# EasyEDA Pro project DDS.eprj

# Schematic Schematic1
Board Name: Board1; Create Date: 2026-07-16; Page Name: P1; Project Name: DDS; Schematic Name: Schematic1; Update Date: 2026-07-16; Company: 嘉立创EDA; Page Size: A4; Version: V1.0
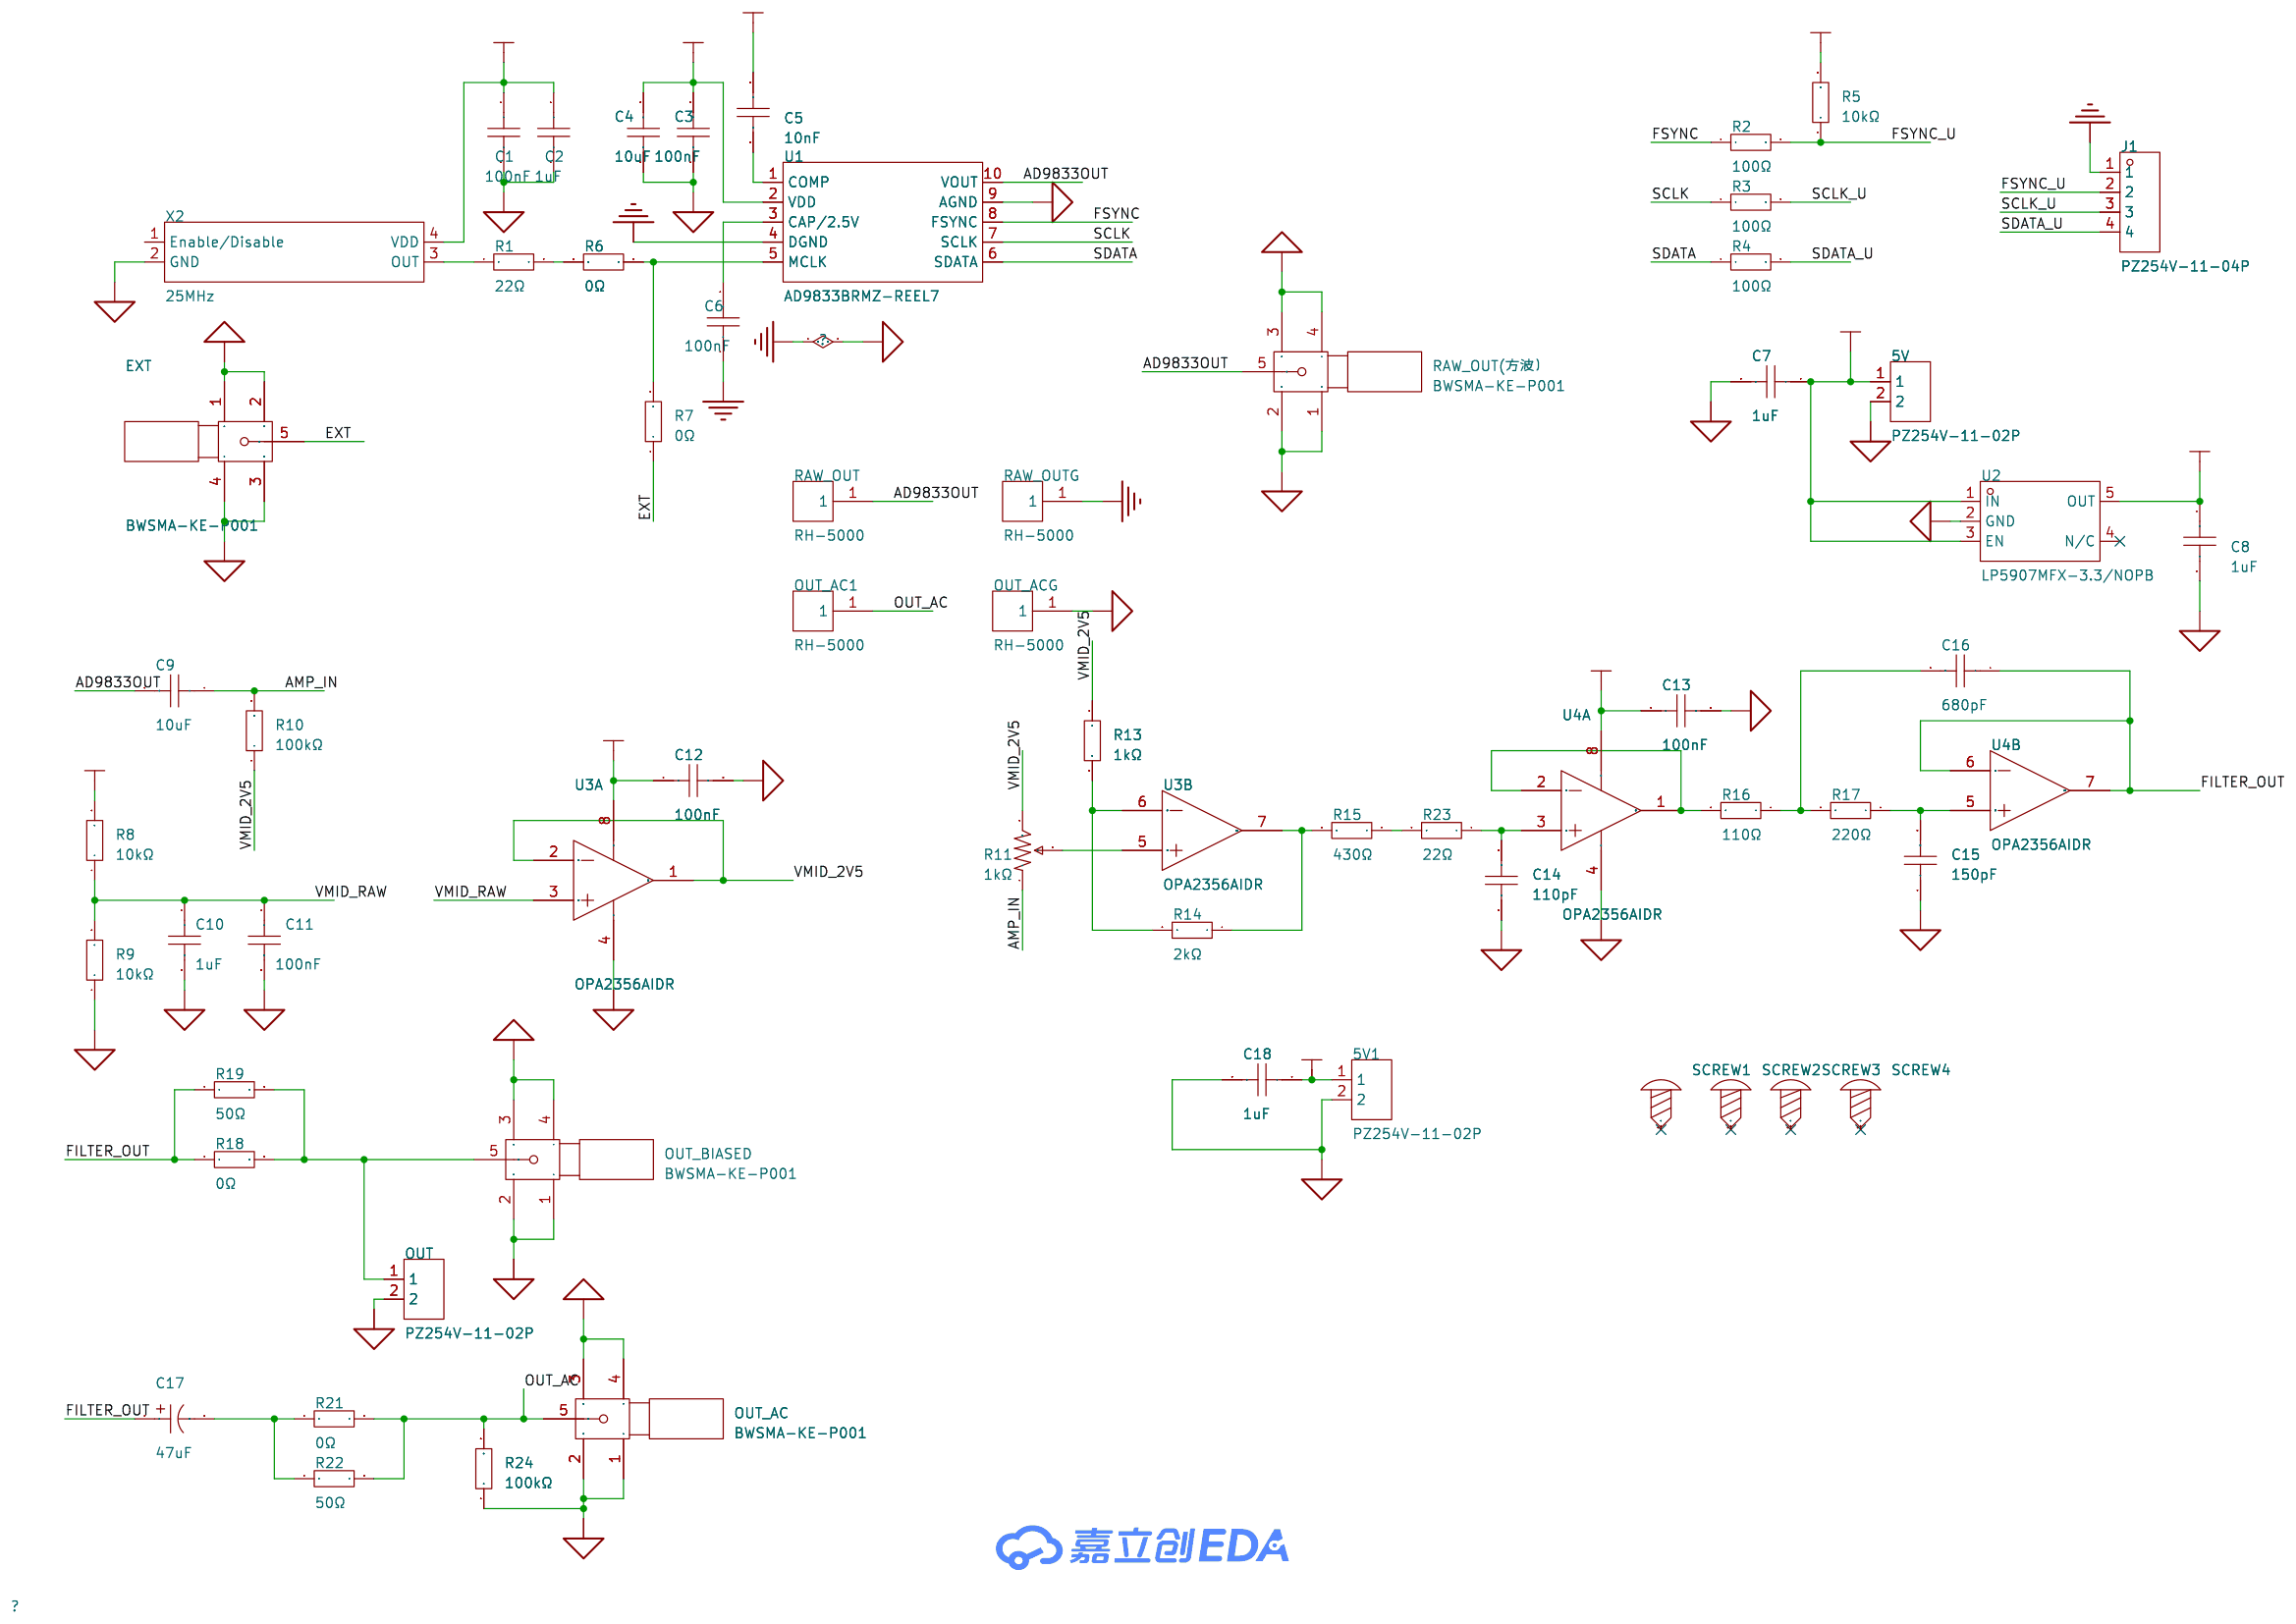
[diagram p0: schematic sheet]

## Parts
5V  PZ254V-11-02P  [HDR-TH_2P-P2.54-V-M]
5V1  PZ254V-11-02P  [HDR-TH_2P-P2.54-V-M]
C1  100nF  [C0603]
C2  1uF  [C0603]
C3  100nF  [C0603]
C4  10uF  [C0603]
C5  10nF  [C0603]
C6  100nF  [C0603]
C7  1uF  [C0603]
C8  1uF  [C0603]
C9  10uF  [C0603]
C10  1uF  [C0603]
C11  100nF  [C0603]
C12  100nF  [C0603]
C13  100nF  [C0603]
C14  110pF  [C0603]
C15  150pF  [C0603]
C16  680pF  [C0603]
C17  47uF  [CAP-SMD_BD6.3-L6.6-W6.6-LS7.3-FD]
C18  1uF  [C0603]
EXT  BWSMA-KE-P001  [SMA-SMD_BWSMA-KE-P001]
J1  PZ254V-11-04P  [HDR-TH_4P-P2.54-V-M]
OUT  PZ254V-11-02P  [HDR-TH_2P-P2.54-V-M]
OUT_AC  BWSMA-KE-P001  [SMA-SMD_BWSMA-KE-P001]
OUT_AC1  RH-5000  [TEST-TH_BD2.54-P1.4_RED]
OUT_ACG  RH-5000  [TEST-TH_BD2.54-P1.4_RED]
OUT_BIASED  BWSMA-KE-P001  [SMA-SMD_BWSMA-KE-P001]
R1  22Ω  [R0603]
R2  100Ω  [R0603]
R3  100Ω  [R0603]
R4  100Ω  [R0603]
R5  10kΩ  [R0603]
R6  0Ω  [R0603]
R7  0Ω  [R0603]
R8  10kΩ  [R0603]
R9  10kΩ  [R0603]
R10  100kΩ  [R0603]
R11  1kΩ  [RES-ADJ-SMD_3224W]
R13  1kΩ  [R0603]
R14  2kΩ  [R0603]
R15  430Ω  [R0603]
R16  110Ω  [R0603]
R17  220Ω  [R0603]
R18  0Ω  [R0603]
R19  50Ω  [R0603]
R21  0Ω  [R0603]
R22  50Ω  [R0603]
R23  22Ω  [R0603]
R24  100kΩ  [R0603]
RAW_OUT  RH-5000  [TEST-TH_BD2.54-P1.4_RED]
RAW_OUT(方波）  BWSMA-KE-P001  [SMA-SMD_BWSMA-KE-P001]
RAW_OUTG  RH-5000  [TEST-TH_BD2.54-P1.4_RED]
SCREW1  -  [M3螺丝]
SCREW2  -  [M3螺丝]
SCREW3  -  [M3螺丝]
SCREW4  -  [M3螺丝]
U1  AD9833BRMZ-REEL7  [MSOP-10_L3.0-W3.0-P0.50-LS5.0-BL]
U2  LP5907MFX-3.3/NOPB  [SOT-23-5_L3.0-W1.7-P0.95-LS2.8-BR]
U3  OPA2356AIDR  [SOIC-8_L5.0-W4.0-P1.27-LS6.1-BL]  (sections 1,2)
U4  OPA2356AIDR  [SOIC-8_L5.0-W4.0-P1.27-LS6.1-BL]  (sections 1,2)
X2  25MHz  [OSC-SMD_4P-L3.2-W2.5-BL]

## Library data of the parts
5V 5V1 OUT = PZ254V-11-02P: LCSC Part Name: 1x2P 间距:2.54mm 方针 直插; Supplier Part: C492401; Manufacturer: XFCN(兴飞); Supplier Footprint: 插件,P=2.54mm; JLCPCB Part Class: 扩展库; Datasheet: https://item.szlcsc.com/datasheet/PZ254V-11-02P/502957.html; Supplier: LCSC; Pin Structure: 1x2P; Pitch: 2.54mm; Circluar Pins/Square Pins: 方针; Mounting Type: 直插; Number of Rows: 单排; Number of Pins: 2P; Current Rating: 3A; Voltage Rating (Max): 250V; Length of Mating Pin: 6mm; Insulation Height: 2.5mm; Length of End Connection Pin: 3mm; Contact Material: 黄铜; Operating Temperature: -40℃~+105℃; Color: 黑色
C1 C3 C6 C11-C13 = CC0603KRX7R9BB104: LCSC Part Name: 100nF ±10% 50V; Supplier Part: C14663; Manufacturer: YAGEO(国巨); Supplier Footprint: 0603; JLCPCB Part Class: Basic Part; Datasheet: https://item.szlcsc.com/datasheet/CC0603KRX7R9BB104/15331.html; Supplier: LCSC; Tolerance: ±10%; Voltage Rating: 50V; Temperature Coefficient: X7R
C2 C7 C8 C10 C18 = CL10A105KB8NNNC: LCSC Part Name: 1uF ±10% 50V; Supplier Part: C15849; Manufacturer: SAMSUNG(三星); Supplier Footprint: 0603; JLCPCB Part Class: Basic Part; Datasheet: https://item.szlcsc.com/datasheet/CL10A105KB8NNNC/16531.html; Supplier: LCSC; Tolerance: ±10%; Voltage Rating: 50V; Temperature Coefficient: X5R
C4 C9 = CL10A106KP8NNNC: LCSC Part Name: 10uF ±10% 10V; Supplier Part: C19702; Manufacturer: SAMSUNG(三星); Supplier Footprint: 0603; JLCPCB Part Class: Basic Part; Datasheet: https://item.szlcsc.com/datasheet/CL10A106KP8NNNC/20411.html; Supplier: LCSC; Tolerance: ±10%; Voltage Rating: 10V; Temperature Coefficient: X5R
C5 = 0603B103K500NT: LCSC Part Name: 10nF ±10% 50V; Supplier Part: C57112; Manufacturer: FH(风华); Supplier Footprint: 0603; JLCPCB Part Class: Basic Part; Datasheet: https://item.szlcsc.com/datasheet/0603B103K500NT/58143.html; Supplier: LCSC; Tolerance: ±10%; Voltage Rating: 50V; Temperature Coefficient: X7R
C14 = CGA0603C0G111J500JT: LCSC Part Name: 110pF ±5% 50V; Supplier Part: C41361116; Manufacturer: HRE(芯声); Supplier Footprint: 0603; JLCPCB Part Class: Extended Part; Datasheet: https://item.szlcsc.com/datasheet/CGA0603C0G111J500JT/43105056.html; Supplier: LCSC; Tolerance: ±5%; Voltage Rating: 50V; Temperature Coefficient: C0G
C15 = 0603B151K500NT: LCSC Part Name: 150pF ±10% 50V; Supplier Part: C1594; Manufacturer: FH(风华); Supplier Footprint: 0603; JLCPCB Part Class: Basic Part; Datasheet: https://item.szlcsc.com/datasheet/0603B151K500NT/1946.html; Supplier: LCSC; Tolerance: ±10%; Voltage Rating: 50V; Temperature Coefficient: X7R
C16 = 0603B681K500NT: LCSC Part Name: 680pF ±10% 50V; Supplier Part: C1630; Manufacturer: FH(风华); Supplier Footprint: 0603; JLCPCB Part Class: Extended Part; Datasheet: https://item.szlcsc.com/datasheet/0603B681K500NT/1982.html; Supplier: LCSC; Tolerance: ±10%; Voltage Rating: 50V; Temperature Coefficient: X7R
C17 = RV63V47M6X8: LCSC Part Name: 47uF ±20% 63V; Supplier Part: C48971005; Manufacturer: JIERR(捷而瑞); Supplier Footprint: SMD,D6.3xL7.7mm; JLCPCB Part Class: 扩展库; Datasheet: https://item.szlcsc.com/datasheet/RV63V47M6X8/51296210.html; Supplier: LCSC; Tolerance: ±20%; Voltage Rating: 63V; Ripple Current: 63mA@120Hz; Diameter: 6.3mm; Height - Seated (Max): 7.7mm; Lifetime: 2000hrs@105℃; Operating Temperature: -40℃~+105℃
EXT OUT_AC OUT_BIASED RAW_OUT(方波） = BWSMA-KE-P001: 连接器类型:板端;射频系列:SMA;接口类型:内孔;端口数量:1;阻抗:-;频率-最大值:-;样式:偏脚;接口直径:5.2mm;接口长度/高度:-;工作温度范围:-;; LCSC Part Name: SMA 内孔 偏脚; Supplier Part: C496550; Manufacturer: BAT WIRELESS(蝙蝠无线); Supplier Footprint: 插件; JLCPCB Part Class: Extended Part; Datasheet: https://atta.szlcsc.com/upload/public/pdf/source/20200416/C496550_06668BF2E3B968EA39F96D17E7156373.pdf; Supplier: LCSC; Connector Type: 板端; RF Series: SMA; Interface Type: 内孔; Number of Ports: 1; Style: 偏脚; Interface Diameter: 5.2mm
J1 = PZ254V-11-04P: LCSC Part Name: 1x4P 间距:2.54mm 方针 直插; Supplier Part: C2691448; Manufacturer: XFCN(兴飞); Supplier Footprint: 插件,P=2.54mm; JLCPCB Part Class: 扩展库; Datasheet: https://item.szlcsc.com/datasheet/PZ254V-11-04P/2801085.html; Supplier: LCSC; Pin Structure: 1x4P; Pitch: 2.54mm; Circluar Pins/Square Pins: 方针; Mounting Type: 直插; Number of Rows: 单排; Number of Pins: 4P; Current Rating: 3A; Voltage Rating (Max): 250V; Length of Mating Pin: 6mm; Insulation Height: 2.5mm; Length of End Connection Pin: 3mm; Operating Temperature: -40℃~+105℃; Color: 黑色
OUT_AC1 OUT_ACG RAW_OUT RAW_OUTG = RH-5000: LCSC Part Name: PCB电路板测试点/测试针; Supplier Part: C5277086; Manufacturer: 荣和; JLCPCB Part Class: 扩展库; Datasheet: https://item.szlcsc.com/datasheet/RH-5000/6009931.html; Supplier: LCSC; Connector Type: 插针型(穿板); Plastic Color: 红色; Board Space (Diameter φ/ Length x Width): 2.5mm
R1 R23 = 0603WAF220JT5E: LCSC Part Name: 22Ω ±1% 100mW 厚膜电阻; Supplier Part: C23345; Manufacturer: UNI-ROYAL(厚声); Supplier Footprint: 0603; JLCPCB Part Class: Basic Part; Datasheet: https://atta.szlcsc.com/upload/public/pdf/source/20200306/C422600_1E6D84923E4A46A82E41ADD87F860B5C.pdf; Supplier: LCSC; Type: 厚膜电阻; Tolerance: ±1%; Power(Watts): 100mW; Overload Voltage (Max): 75V; Temperature Coefficient: ±100ppm/℃; Operating Temperature Range: -55℃~+155℃
R2-R4 = 0603WAF1000T5E: LCSC Part Name: 100Ω ±1% 100mW 厚膜电阻; Supplier Part: C22775; Manufacturer: UNI-ROYAL(厚声); Supplier Footprint: 0603; JLCPCB Part Class: Basic Part; Datasheet: https://atta.szlcsc.com/upload/public/pdf/source/20200306/C422600_1E6D84923E4A46A82E41ADD87F860B5C.pdf; Supplier: LCSC; Type: 厚膜电阻; Tolerance: ±1%; Power(Watts): 100mW; Overload Voltage (Max): 75V; Temperature Coefficient: ±200ppm/℃; Operating Temperature Range: -55℃~+155℃
R5 R8 R9 = 0603WAF1002T5E: LCSC Part Name: 厚膜电阻 10kΩ ±1% 100mW; Supplier Part: C25804; Manufacturer: UNI-ROYAL(厚声); Supplier Footprint: 0603; JLCPCB Part Class: Basic Part; Datasheet: https://item.szlcsc.com/datasheet/0603WAF1002T5E/26547.html; Supplier: LCSC; Type: 厚膜电阻; Tolerance: ±1%; Power(Watts): 100mW; Voltage-Supply(Max): 75V; Temperature Coefficient: ±100ppm/℃; Operating Temperature: -55℃~+155℃
R6 R7 R18 R21 = 0603WAF0000T5E: LCSC Part Name: 0Ω ±1% 100mW 厚膜电阻; Supplier Part: C21189; Manufacturer: UNI-ROYAL(厚声); Supplier Footprint: 0603; JLCPCB Part Class: Basic Part; Datasheet: https://item.szlcsc.com/datasheet/0603WAF0000T5E/21903.html; Supplier: LCSC; Type: 厚膜电阻; Tolerance: ±1%; Power(Watts): 100mW; Voltage-Supply(Max): 75V; Operating Temperature: -55℃~+155℃
R10 R24 = 0603WAF1003T5E: LCSC Part Name: 100kΩ ±1% 100mW 厚膜电阻; Supplier Part: C25803; Manufacturer: UNI-ROYAL(厚声); Supplier Footprint: 0603; JLCPCB Part Class: Basic Part; Datasheet: https://item.szlcsc.com/datasheet/0603WAF1003T5E/26546.html; Supplier: LCSC; Type: 厚膜电阻; Tolerance: ±1%; Power(Watts): 100mW; Voltage-Supply(Max): 75V; Temperature Coefficient: ±100ppm/℃; Operating Temperature: -55℃~+155℃
R11 = 3224W-1-102E_C27974758: LCSC Part Name: 贴片多圈可调W1K; Supplier Part: C27974758; Manufacturer: BOCHEN(博晨); Manufacturer Part: 3224W-1-102E; Supplier Footprint: SMD-3P,5x4.8mm; JLCPCB Part Class: 扩展库; Datasheet: https://item.szlcsc.com/datasheet/3224W-1-102E/29710599.html; Supplier: LCSC; Tolerance: ±10%; Power(Watts): 250mW; Temperature Coefficient: ±100ppm/℃; Number of Turns: 10
R13 = 0603WAF1001T5E: LCSC Part Name: 1kΩ ±1% 100mW 厚膜电阻; Supplier Part: C21190; Manufacturer: UNI-ROYAL(厚声); Supplier Footprint: 0603; JLCPCB Part Class: Basic Part; Datasheet: https://item.szlcsc.com/datasheet/0603WAF1001T5E/21904.html; Supplier: LCSC; Type: 厚膜电阻; Tolerance: ±1%; Power(Watts): 100mW; Voltage-Supply(Max): 75V; Temperature Coefficient: ±100ppm/℃; Operating Temperature: -55℃~+155℃
R14 = 0603WAF2001T5E: LCSC Part Name: 2kΩ ±1% 100mW 厚膜电阻; Supplier Part: C22975; Manufacturer: UNI-ROYAL(厚声); Supplier Footprint: 0603; JLCPCB Part Class: Basic Part; Datasheet: https://item.szlcsc.com/datasheet/0603WAF2001T5E/23702.html; Supplier: LCSC; Type: 厚膜电阻; Tolerance: ±1%; Power(Watts): 100mW; Voltage-Supply(Max): 75V; Temperature Coefficient: ±100ppm/℃; Operating Temperature: -55℃~+155℃
R15 = 0603WAF4300T5E: LCSC Part Name: 430Ω ±1% 100mW 厚膜电阻; Supplier Part: C23170; Manufacturer: UNI-ROYAL(厚声); Supplier Footprint: 0603; JLCPCB Part Class: Extended Part; Datasheet: https://item.szlcsc.com/datasheet/0603WAF4300T5E/23897.html; Supplier: LCSC; Type: 厚膜电阻; Tolerance: ±1%; Power(Watts): 100mW; Voltage-Supply(Max): 75V; Temperature Coefficient: ±100ppm/℃; Operating Temperature: -55℃~+155℃
R16 = 0603WAF1100T5E: LCSC Part Name: 110Ω ±1% 100mW 厚膜电阻; Supplier Part: C22781; Manufacturer: UNI-ROYAL(厚声); Supplier Footprint: 0603; JLCPCB Part Class: Extended Part; Datasheet: https://item.szlcsc.com/datasheet/0603WAF1100T5E/23508.html; Supplier: LCSC; Type: 厚膜电阻; Tolerance: ±1%; Power(Watts): 100mW; Voltage-Supply(Max): 75V; Temperature Coefficient: ±100ppm/℃; Operating Temperature: -55℃~+155℃
R17 = 0603WAF2200T5E: LCSC Part Name: 220Ω ±1% 100mW 厚膜电阻; Supplier Part: C22962; Manufacturer: UNI-ROYAL(厚声); Supplier Footprint: 0603; JLCPCB Part Class: Basic Part; Datasheet: https://atta.szlcsc.com/upload/public/pdf/source/20200306/C422600_1E6D84923E4A46A82E41ADD87F860B5C.pdf; Supplier: LCSC; Type: 厚膜电阻; Tolerance: ±1%; Power(Watts): 100mW; Overload Voltage (Max): 75V; Temperature Coefficient: ±100ppm/℃; Operating Temperature Range: -55℃~+155℃
R19 R22 = RT0603BRE0750RL: LCSC Part Name: 薄膜电阻 50Ω ±0.1% 100mW; Supplier Part: C849792; Manufacturer: YAGEO(国巨); Supplier Footprint: 0603; JLCPCB Part Class: Extended Part; Datasheet: https://item.szlcsc.com/datasheet/RT0603BRE0750RL/922274.html; Supplier: LCSC; Type: 薄膜电阻; Tolerance: ±0.1%; Power(Watts): 100mW; Voltage-Supply(Max): 75V; Temperature Coefficient: ±50ppm/℃; Operating Temperature: -55℃~+155℃
SCREW1-SCREW4 = M3螺丝: Supplier Footprint: 插件
U1 = AD9833BRMZ-REEL7_C9652: LCSC Part Name: AD9833低功耗DDS设备; Supplier Part: C9652; Manufacturer: ADI(亚德诺); Supplier Footprint: MSOP-10; JLCPCB Part Class: 扩展库; Datasheet: https://item.szlcsc.com/datasheet/AD9833BRMZ-REEL7/10182.html; Supplier: LCSC; Voltage - Supply: 2.3V~5.5V; Resolution (Bits): 10; The main FCLK: 25MHz; Operating Temperature: -40℃~+85℃; Interface: SPI; Frequency Output: 12.5MHz; Integral non - linearity: 1LSB; Pd - Power Dissipation: 12.65mW; Frequency Registers(bit): 28; Features: 集成调制器；相位连续切换；使能/关断功能；低功耗模式; Output Type: 电压; Spurious-Free Dynamic Range (SFDR): 60dB
U2 = LP5907MFX-3.3/NOPB: LCSC Part Name: 3.3V 250mA 5.5V; Supplier Part: C80670; Manufacturer: TI(德州仪器); Supplier Footprint: SOT-23-5; JLCPCB Part Class: 扩展库; Datasheet: https://www.ti.com/cn/lit/ds/symlink/lp5907.pdf; Supplier: LCSC; Output Configuration: 正极; Voltage - Supply: 5.5V; Output Voltage: 3.3V; Output Current: 250mA; Power Supply Rejection Ratio (PSRR): 82dB@(1kHz); Voltage Dropout: 250mV@(250mA); standby current: 12uA; Noise: 10uVrms; Features: 热关断；使能控制；输出放电；短路保护；输入欠压保护; Operating Temperature: -40℃~+125℃@(Tj); Output Type: 固定; Number of Outputs: 1
U3 U4 = OPA2356AIDR: LCSC Part Name: 200MHz, CMOS 运算放大器; Supplier Part: C2867057; Manufacturer: TI(德州仪器); Supplier Footprint: SOIC-8; JLCPCB Part Class: 扩展库; Datasheet: https://www.ti.com/cn/lit/gpn/opa356; Supplier: LCSC; Number of Channels: 2; Maximum Power Supply Range (Vdd-Vss): 7.5V; Rail to Rail: 轨到轨输出; Gain Bandwidth Product: 200MHz; Vos - Input Offset Voltage: 9mV; Input Offset Voltage Drift(Vos TC): 7uV/℃; Slew Rate: 360V/us; Ib - Input Bias Current: 50pA; Input Offset Current(Ios): 50pA; Input Voltage Noise Density: 5.8nV/√Hz@1MHz; Common Mode Rejection Ratio(CMRR): 80dB; Quiescent Current: 8.3mA; Output Current: 60mA; Operating Temperature: -40℃~+125℃; Single supply: 2.5V~5.5V; Dual Supply: -2.75V~-1.25V；1.25V~2.75V
X2 = OT322525MJBA4SL: LCSC Part Name: YSO110TR 25MHZ 1.8V-3.3V ±10PPM -40~85℃（±20PPM) CMOS; Supplier Part: C669088; Manufacturer: YXC(扬兴晶振); Supplier Footprint: SMD3225-4P; JLCPCB Part Class: 扩展库; Datasheet: https://item.szlcsc.com/datasheet/OT322525MJBA4SL/699188.html; Supplier: LCSC; Normal temperature Frequency Tolerance: ±10ppm; Output Type: CMOS; Voltage - Supply: 1.8V~3.3V; Current - Supply: 5mA; Frequency Stability: ±20ppm; Operating Temperature: -40℃~+85℃

## Nets
3V3: C1.2 C2.2 C3.2 C4.2 C5.1 C8.1 R5.2 U1.2(VDD) U2.5(OUT) X2.4(VDD)
5V: 5V.1 C7.1 U2.1(IN) U2.3(EN)
5V_A: 5V1.1 C12.1 C13.1 C18.1 R8.2 U3.8(V+) U4.8(V+)
AGND: 5V.2 5V1.2 C1.1 C2.1 C3.1 C4.1 C6.1 C7.2 C8.2 C10.2 C11.2 C12.2 C13.2 C14.1 C15.1 C18.2 EXT.1 EXT.2 EXT.3 EXT.4 J1.1 OUT.2 OUT_AC.1 OUT_AC.2 OUT_AC.3 OUT_AC.4 OUT_ACG.1 OUT_BIASED.1 OUT_BIASED.2 OUT_BIASED.3 OUT_BIASED.4 R9.1 R24.1 RAW_OUT(方波）.1 RAW_OUT(方波）.2 RAW_OUT(方波）.3 RAW_OUT(方波）.4 RAW_OUTG.1 U1.4(DGND) U1.9(AGND) U2.2(GND) U3.4(V-) U4.4(V-) X2.2(GND)
AD9833OUT: C9.2 RAW_OUT.1 RAW_OUT(方波）.5 U1.10(VOUT)
AMP_IN: C9.1 R10.2 R11.1
EXT: EXT.5 R7.1
FILTER_OUT: C16.1 C17.1 R18.1 R19.1 U4.6(INB-) U4.7(OUTB)
FSYNC: R2.1 U1.8(FSYNC)
FSYNC_U: J1.2 R2.2 R5.1
OUT_AC: OUT_AC.5 OUT_AC1.1 R21.2 R22.2 R24.2
SCLK: R3.1 U1.7(SCLK)
SCLK_U: J1.3 R3.2
SDATA: R4.1 U1.6(SDATA)
SDATA_U: J1.4 R4.2
VMID_2V5: R10.1 R11.3 R13.1 U3.1(OUTA) U3.2(INA-)
VMID_RAW: C10.1 C11.1 R8.1 R9.2 U3.3(INA+)
$1N474: R1.1 X2.3(OUT)
$1N1232: C6.2 U1.3(CAP/2.5V)
$1N1272: C5.2 U1.1(COMP)
$1N1684: R6.1 R7.2 U1.5(MCLK)
$1N1686: R1.2 R6.2
$1N5113: R11.2 U3.5(INB+)
$1N5226: R14.1 R15.2 U3.7(OUTB)
$1N5324: R13.2 R14.2 U3.6(INB-)
$1N5858: R16.2 U4.1(OUTA) U4.2(INA-)
$1N5895: C16.2 R16.1 R17.2
$1N5900: C15.2 R17.1 U4.5(INB+)
$1N6266: OUT.1 OUT_BIASED.5 R18.2 R19.2
$1N6533: C17.2 R21.1 R22.1
$1N6657: R15.1 R23.2
$1N6662: C14.2 R23.1 U4.3(INA+)

Not connected (* = marked no-connect by the designer): SCREW1 1*; SCREW2 1*; SCREW3 1*; SCREW4 1*; U2 4(N/C)*; X2 1(Enable/Disable)

# Board PCB1
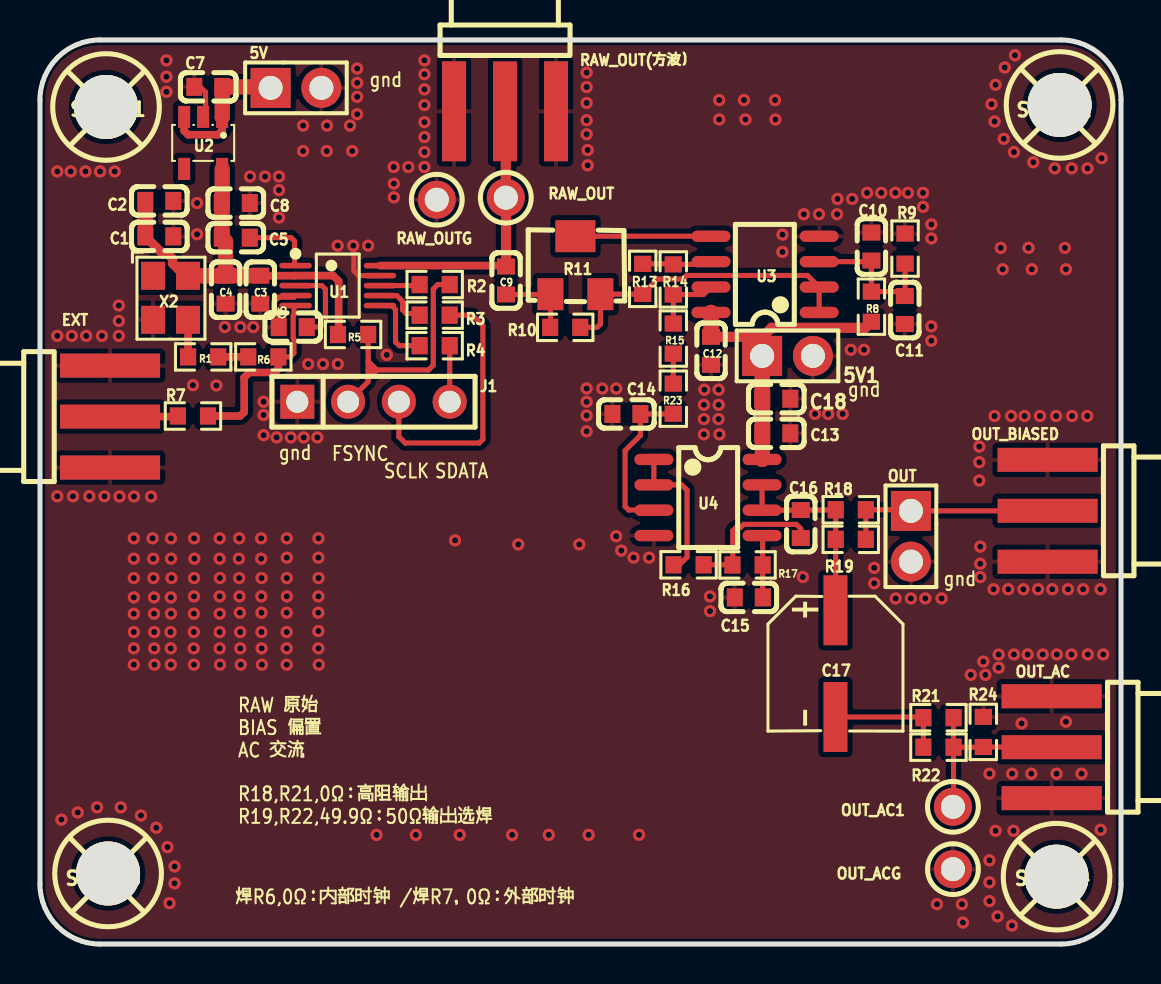
[diagram p1: board, top side]
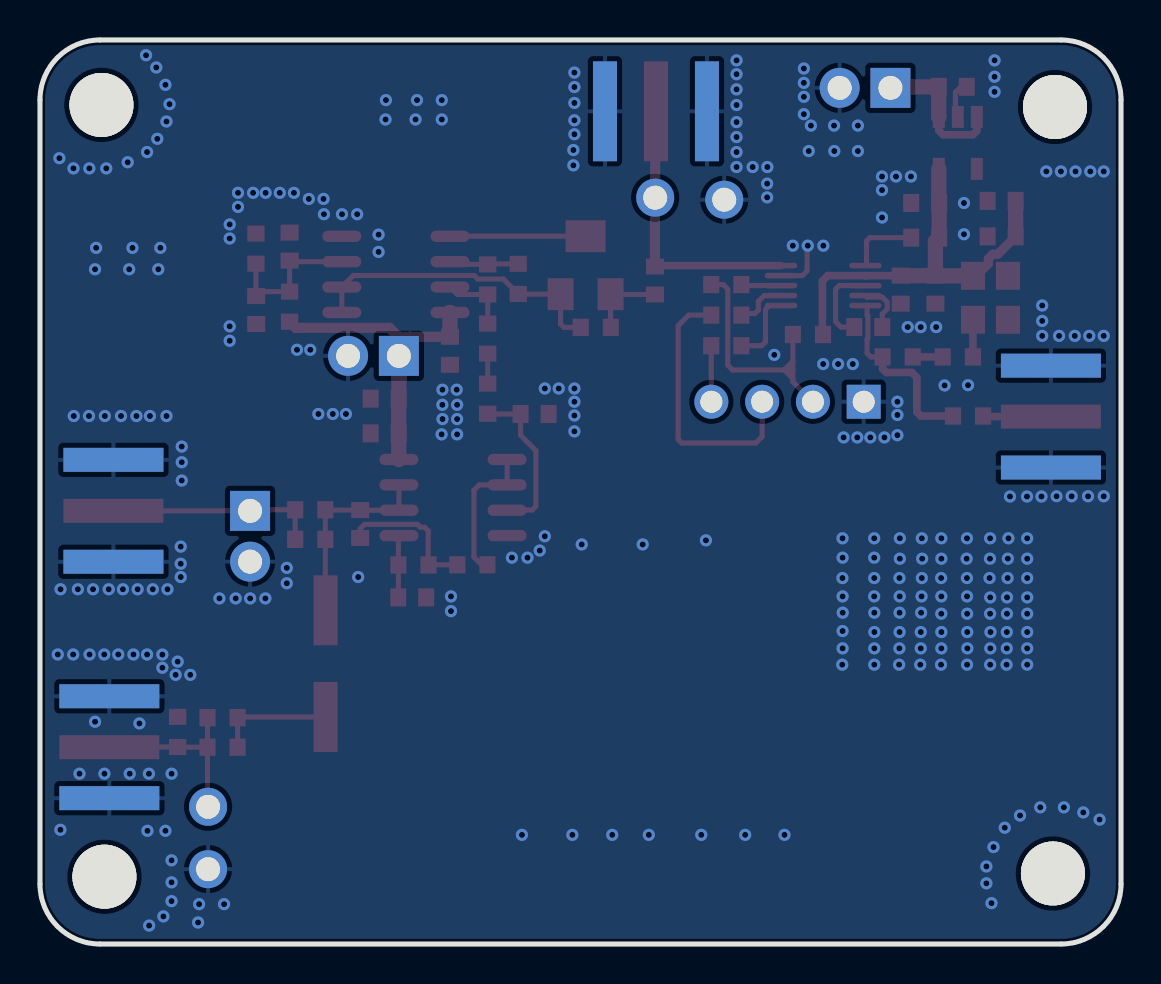
[diagram p2: board, bottom side, seen from below]

Outline 54.06 x 45.24 mm; copper layers: Top Layer, Bottom Layer. Coordinates in mm from the lower left corner of the outline.
Outline path: 0,42.24 0,3 arc(0.88,0.88) 3,0 51.06,0 arc(53.18,0.88) 54.06,3 54.06,42.24 arc(53.18,44.37) 51.06,45.24 3,45.24 arc(0.88,44.37) 0,42.24
Stack: Top Layer 0.035mm / Dielectric1 1.51mm FR4 er 4.5 / Bottom Layer 0.035mm

## Design rules (mm)
template: JLCPCB Capability(Two Layers Board)
spacing copperThickness1oz (default): track to track 0.102, other pairs 0.152 to 0.3
spacing copperThickness2oz: track to track 0.203, other pairs 0.152 to 0.3
track width copperThickness1oz (default): min 0.127, default 0.254, max 2.54
track width copperThickness2oz: min 0.203, default 0.254, max 2.54
differential pair differentialPair (default): width min 0.127, default 0.254, max 2.54; gap min 0.152, default 0.152
via viaSize (default): diameter min 0.5, default 0.61, max 10; hole min 0.3, default 0.305, max 6.3

## Placement (name value [footprint] x y rotation side)
5V  PZ254V-11-02P  [HDR-TH_2P-P2.54-V-M]  12.8 42.85 0 top
5V1  PZ254V-11-02P  [HDR-TH_2P-P2.54-V-M]  37.38 29.43 0 top
C1  100nF  [C0603]  5.97 35.41 180 top
C2  1uF  [C0603]  5.97 37.19 180 top
C3  100nF  [C0603]  11.02 32.75 90 top
C4  10uF  [C0603]  9.28 32.75 90 top
C5  10nF  [C0603]  9.79 35.35 0 top
C6  100nF  [C0603]  12.64 30.88 0 top
C7  1uF  [C0603]  8.42 42.9 180 top
C8  1uF  [C0603]  9.79 37.08 0 top
C9  10uF  [C0603]  23.31 33.21 90 top
C10  1uF  [C0603]  41.58 34.91 90 top
C11  100nF  [C0603]  43.25 31.73 270 top
C12  100nF  [C0603]  33.56 29.69 270 top
C13  100nF  [C0603]  36.82 25.56 0 top
C14  110pF  [C0603]  29.33 26.53 0 top
C15  150pF  [C0603]  35.45 17.35 0 top
C16  680pF  [C0603]  38.05 21.02 270 top
C17  47uF  [CAP-SMD_BD6.3-L6.6-W6.6-LS7.3-FD]  39.78 14.03 270 top
C18  1uF  [C0603]  36.82 27.29 0 top
EXT  BWSMA-KE-P001  [SMA-SMD_BWSMA-KE-P001]  3.5 26.4 180 top
J1  PZ254V-11-04P  [HDR-TH_4P-P2.54-V-M]  16.68 27.14 0 top
OUT  PZ254V-11-02P  [HDR-TH_2P-P2.54-V-M]  43.55 20.41 270 top
OUT_AC  BWSMA-KE-P001  [SMA-SMD_BWSMA-KE-P001]  50.59 9.85 0 top
OUT_AC1  RH-5000  [TEST-TH_BD2.54-P1.4_RED]  45.65 6.87 0 top
OUT_ACG  RH-5000  [TEST-TH_BD2.54-P1.4_RED]  45.66 3.75 0 top
OUT_BIASED  BWSMA-KE-P001  [SMA-SMD_BWSMA-KE-P001]  50.39 21.68 0 top
R1  22Ω  [R0603]  8.16 29.38 0 top
R2  100Ω  [R0603]  19.74 33 0 top
R3  100Ω  [R0603]  19.74 31.47 0 top
R4  100Ω  [R0603]  19.74 29.94 0 top
R5  10kΩ  [R0603]  15.66 30.5 180 top
R6  0Ω  [R0603]  11.17 29.38 180 top
R7  0Ω  [R0603]  7.65 26.42 0 top
R8  10kΩ  [R0603]  41.58 31.9 270 top
R9  10kΩ  [R0603]  43.26 34.8 270 top
R10  100kΩ  [R0603]  26.27 30.86 180 top
R11  1kΩ  [RES-ADJ-SMD_3224W]  26.78 33.97 0 top
R13  1kΩ  [R0603]  30.14 33.29 90 top
R14  2kΩ  [R0603]  31.67 33.26 90 top
R15  430Ω  [R0603]  31.67 30.3 90 top
R16  110Ω  [R0603]  32.44 18.98 180 top
R17  220Ω  [R0603]  35.38 18.97 180 top
R18  0Ω  [R0603]  40.55 21.73 0 top
R19  50Ω  [R0603]  40.55 20.25 0 top
R21  0Ω  [R0603]  44.93 11.33 0 top
R22  50Ω  [R0603]  44.93 9.85 0 top
R23  22Ω  [R0603]  31.67 27.29 90 top
R24  100kΩ  [R0603]  47.18 10.62 270 top
RAW_OUT  RH-5000  [TEST-TH_BD2.54-P1.4_RED]  23.3 37.35 0 top
RAW_OUT(方波）  BWSMA-KE-P001  [SMA-SMD_BWSMA-KE-P001]  23.26 41.67 90 top
RAW_OUTG  RH-5000  [TEST-TH_BD2.54-P1.4_RED]  19.84 37.25 0 top
SCREW1  -  [M3螺丝]  3.37 41.83 0 top
SCREW2  -  [M3螺丝]  51.05 41.93 0 top
SCREW3  -  [M3螺丝]  3.47 3.47 0 top
SCREW4  -  [M3螺丝]  50.9 3.31 0 top
U1  AD9833BRMZ-REEL7  [MSOP-10_L3.0-W3.0-P0.50-LS5.0-BL]  14.89 32.95 270 top
U2  LP5907MFX-3.3/NOPB  [SOT-23-5_L3.0-W1.7-P0.95-LS2.8-BR]  8.16 40.09 90 top
U3  OPA2356AIDR  [SOIC-8_L5.0-W4.0-P1.27-LS6.1-BL]  36.26 33.51 90 top
U4  OPA2356AIDR  [SOIC-8_L5.0-W4.0-P1.27-LS6.1-BL]  33.41 22.34 270 top
X2  25MHz  [OSC-SMD_4P-L3.2-W2.5-BL]  6.53 32.34 270 top

## Footprints (pads in the part's own frame, mm; a bottom-side part is the same pattern mirrored in y, then rotated)
C0603
  rect 0.8x0.9 smd: 1(-0.7,0) 2(0.7,0)
CAP-SMD_BD6.3-L6.6-W6.6-LS7.3-FD
  rect 3.5x1.2 smd: 1(-2.67,0) 2(2.67,0)
HDR-TH_2P-P2.54-V-M
  rect 2x2 hole 1.2: 1(-1.27,0)
  round 2 hole 1.2: 2(1.27,0)
HDR-TH_4P-P2.54-V-M
  rect 1.7x1.7 hole 1.1: 1(-3.81,0)
  round 1.7 hole 1.1: 2(-1.27,0) 3(1.27,0) 4(3.81,0)
M3螺丝
  round 3.2 hole 3.2: 1(-0.064,0.064)
MSOP-10_L3.0-W3.0-P0.50-LS5.0-BL
  oval 0.28x1.62 smd: 1(-1,-2.11) 2(-0.5,-2.11) 3(0,-2.11) 4(0.5,-2.11) 5(1,-2.11) 6(1,2.11) 7(0.5,2.11) 8(0,2.11) 9(-0.5,2.11) 10(-1,2.11)
OSC-SMD_4P-L3.2-W2.5-BL
  rect 1.4x1.2 smd: 1(-1.1,-0.875) 2(1.1,-0.875) 3(1.1,0.875) 4(-1.1,0.875)
R0603
  rect 0.806x0.864 smd: 1(-0.753,0) 2(0.753,0)
RES-ADJ-SMD_3224W
  rect 1.3x1.6 smd: 1(-1.25,-1.45) 3(1.25,-1.45)
  rect 2x1.6 smd: 2(0,1.45)
SMA-SMD_BWSMA-KE-P001
  rect 5x1.2 smd: 1(0,-2.55) 2(0,2.55) 5(0,0)
  rect 5x1.2 smd far side: 3(0,2.55) 4(0,-2.55)
SOIC-8_L5.0-W4.0-P1.27-LS6.1-BL
  oval 0.569x1.95 smd: 1(-1.905,-2.705) 2(-0.635,-2.705) 3(0.635,-2.705) 4(1.905,-2.705) 5(1.905,2.705) 6(0.635,2.705) 7(-0.635,2.705) 8(-1.905,2.705)
SOT-23-5_L3.0-W1.7-P0.95-LS2.8-BR
  rect 1.1x0.6 smd: 1(1.3,-0.95) 2(1.3,0) 3(1.3,0.95) 4(-1.3,0.95) 5(-1.3,-0.95)
TEST-TH_BD2.54-P1.4_RED
  round 1.9 hole 1.2: 1(0,0)

## Nets
As in the schematic.

Pads without a net: SCREW1 1; SCREW2 1; SCREW3 1; SCREW4 1; U2 4; X2 1

## Via types
v1: diameter 0.61, hole 0.305, Top Layer to Bottom Layer, 292 vias
v2: diameter 0.6, hole 0.3, Top Layer to Bottom Layer, 1 via

## Routing (per net, layer and track width the routed paths; a pad name or vN(x,y) marks a point on that pad's centre or on a via; arc(x,y) is an arc through that point)
3V3: length 20.6
  Top Layer w0.381: C3.2 12.78,33.45 U1.2 14.66,33.45 14.93,33.18 14.93,30.54 14.9,30.5
  Top Layer w0.457: X2.4 7.24,33.44 6.63,34.05 6.63,34.3 6.41,34.52 6.16,34.52 C1.2
  Top Layer w0.762: C4.2 9.27,33.44 X2.4 ; C4.2 C3.2 ; C4.2 9.28,35.16 C5.1 C8.1 9.11,37.1 U2.5 ; C2.2 C1.2
5V: length 7.4
  Top Layer w0.381: 7.21,41.39 7.21,40.7 7.41,40.5 8.9,40.5 9.11,40.72 9.11,41.4
  Top Layer w0.762: U2.1 9.11,41.4 C7.1 11.48,42.9 5V.1
5V_A: length 15.9
  Top Layer w0.508: R8.2 41.27,30.84 36.59,30.84 36.14,30.39 35.57,30.39 ; 35.57,30.39 36.11,29.84 5V1.1 ; 35.57,30.39 C12.1
  Top Layer w0.762: U4.8 36.12,24.26 C13.1 C18.1 36.11,27.3 5V1.1 ; U3.8 33.56,31.61 C12.1
AGND: length 7.2
  Top Layer w0.254: C7.2 8.01,42.9 8.28,42.63 8.28,41.51 U2.2 ; C6.1 11.94,31.53 11.69,31.78 11.69,32.13 11.94,32.37 12.7,32.37 U1.4 ; v1(15.67,34.95) 15.7,34.92 15.7,33.69 15.93,33.45 17,33.45
  vias: v1(0.86,38.66) v1(0.86,30.44) v1(0.86,22.41) v1(1.07,6.23) v1(1.54,38.66) v1(1.59,30.44) v1(1.65,22.41) v1(1.89,6.59) v1(2.27,38.66) v1(2.31,30.44) v1(2.47,22.41) v1(2.86,6.84) v1(3.01,38.66) v1(3.1,30.44) v1(3.74,38.66) v1(3.94,31.96) v1(3.94,31.19) v1(3.94,30.44) v1(3.98,22.4) v1(4.04,6.84) v1(4.69,20.31) v1(4.69,19.28) v1(4.69,18.32) v1(4.69,17.35) v1(4.69,16.53) v1(4.69,15.61) v1(4.69,14.8) v1(4.69,13.98) v1(4.7,22.4) v1(5.05,6.43) v1(5.55,22.4) v1(5.63,20.31) v1(5.66,19.28) v1(5.67,18.32) v1(5.7,17.35) v1(5.7,16.53) v1(5.71,15.61) v1(5.71,14.8) v1(5.72,13.98) v1(5.81,5.82) v1(6.32,44.22) v1(6.32,43.4) v1(6.32,42.65) v1(6.38,4.85) v1(6.48,2.05) v1(6.55,20.31) v1(6.55,19.28) v1(6.57,18.32) v1(6.54,17.35) v1(6.55,16.53) v1(6.53,15.61) v1(6.54,14.8) v1(6.54,13.98) v1(6.73,3.88) v1(6.73,3.04) v1(7.65,27.97) v1(7.7,16.53) v1(7.69,15.61) v1(7.69,14.8) v1(7.7,20.31) v1(7.72,19.28) v1(7.71,18.32) v1(7.7,17.4) v1(7.7,13.98) v1(7.85,37.08) v1(7.85,35.52) v1(8.82,27.95) v1(8.99,20.31) v1(8.98,19.28) v1(9,18.32) v1(8.99,17.4) v1(8.99,16.53) v1(8.98,15.61) v1(8.99,14.8) v1(9,13.98) v1(9.24,30.88) v1(9.96,20.31) v1(9.95,19.28) v1(9.96,18.32) v1(9.98,17.4) v1(10,16.58) v1(10.02,30.88) v1(10.01,15.61) v1(10.02,14.8) v1(10.04,13.98) v1(10.51,38.41) v1(10.67,30.88) v1(11.06,20.31) v1(11.06,19.28) v1(11.08,18.32) v1(11.07,17.4) v1(11.07,16.58) v1(11.07,15.61) v1(11.08,14.8) v1(11.1,13.98) v1(11.18,27.14) v1(11.18,26.48) v1(11.18,25.47) v1(11.25,38.41) v1(11.83,25.35) v1(11.95,38.41) v1(11.95,37.73) v1(11.95,36.36) v1(12.34,20.31) v1(12.34,19.34) v1(12.34,18.32) v1(12.34,17.4) v1(12.34,16.58) v1(12.33,15.61) v1(12.34,14.8) v1(12.34,13.98) v1(12.54,25.35) v1(13.16,40.96) v1(13.16,39.69) v1(13.19,25.35) v1(13.41,29.03) v1(13.87,25.35) v1(13.93,20.31) v1(13.92,19.34) v1(13.93,18.32) v1(13.92,17.4) v1(13.92,16.58) v1(13.92,15.66) v1(13.92,14.8) v1(13.94,13.98) v1(14.15,29.03) v1(14.35,40.96) v1(14.34,39.69) v1(14.89,34.95) v1(14.89,29.03) v1(15.51,40.96) v1(15.62,39.69) v1(15.86,43.82) v1(15.86,43.1) v1(15.86,42.4) v1(15.86,41.53) v1(16.41,34.95) v1(16.83,5.46) v1(17.34,29.48) v1(17.69,38.89) v1(17.7,38.05) v1(17.7,37.37) v1(18.42,38.89) v1(18.8,5.46) v1(19.23,44.22) v1(19.23,43.53) v1(19.23,42.77) v1(19.23,41.99) v1(19.23,41.13) v1(19.23,40.39) v1(19.23,39.63) v1(19.23,38.89) v1(20.76,20.2) v1(20.99,5.46) v1(23.61,5.46) v1(23.92,20) v1(25.44,5.46) v1(26.97,20) v1(27.34,43.61) v1(27.34,42.89) v1(27.34,42.09) v1(27.34,41.23) v1(27.34,40.53) v1(27.39,39.74) v1(27.39,38.97) v1(27.34,27.8) v1(27.34,27.14) v1(27.34,26.45) v1(27.34,25.66) v1(27.44,5.46) v1(28.12,27.8) v1(28.82,27.8) v1(28.82,20.41) v1(29.07,19.69) v1(29.68,19.34) v1(29.96,5.46) v1(30.46,19.34) v1(33.22,27.74) v1(33.2,26.99) v1(33.2,26.27) v1(33.2,25.51) v1(33.51,17.4) v1(33.51,16.66) v1(33.97,42.23) v1(33.97,41.27) v1(33.93,27.74) v1(33.94,26.99) v1(33.93,26.27) v1(33.98,25.51) v1(35.21,42.23) v1(35.28,41.27) v1(36.76,42.23) v1(36.78,41.27) v1(37.13,35.5) v1(37.13,34.64) v1(38.15,18.37) v1(38.2,36.52) v1(38.76,26.53) v1(38.96,36.52) v1(39.42,26.53) v1(39.88,37.29) v1(39.86,36.52) v1(40.14,26.53) v1(40.55,29.74) v1(40.62,37.29) v1(41.21,29.74) v1(41.36,37.59) v1(41.72,18.83) v1(41.72,18.05) v1(42.07,37.59) v1(42.78,37.59) v1(42.79,17.3) v1(43.4,37.59) v1(43.55,17.3) v1(44.16,37.59) v1(44.16,36.89) v1(44.27,17.3) v1(44.57,36.01) v1(44.57,35.31) v1(44.57,30.91) v1(44.57,30.19) v1(44.86,2) v1(45.09,17.3) v1(46.1,2) v1(46.16,1.08) v1(46.54,13.47) v1(46.97,24.89) v1(46.97,24.11) v1(46.97,23.2) v1(47.02,19.89) v1(47.02,19.03) v1(47.02,18.37) v1(47.18,14.13) v1(47.28,13.47) v1(47.48,8.52) v1(47.48,4.19) v1(47.48,3.09) v1(47.48,2.15) v1(47.58,42.03) v1(47.69,17.75) v1(47.79,43) v1(47.74,41.16) v1(47.74,26.42) v1(47.79,5.67) v1(47.89,1.38) v1(47.94,14.49) v1(47.94,13.83) v1(48.04,34.84) v1(48.2,40.3) v1(48.14,33.77) v1(48.25,43.87) v1(48.42,17.75) v1(48.56,26.42) v1(48.61,8.52) v1(48.69,5.67) v1(48.6,0.92) v1(48.76,44.48) v1(48.71,39.63) v1(48.71,14.49) v1(49.09,11.04) v1(49.18,17.75) v1(49.24,26.42) v1(49.39,14.49) v1(49.44,34.84) v1(49.57,8.52) v1(49.67,39.12) v1(49.6,33.77) v1(49.91,17.75) v1(50.01,26.42) v1(50.15,14.49) v1(50.62,17.75) v1(50.75,38.82) v1(50.82,26.42) v1(50.85,14.49) v1(50.84,8.52) v1(51.25,34.84) v1(51.31,33.77) v1(51.31,11.12) v1(51.41,17.75) v1(51.59,38.82) v1(51.58,14.49) v1(51.61,26.42) v1(52.09,8.52) v1(52.17,17.75) v1(52.39,38.82) v1(52.37,26.42) v1(52.4,14.49) v1(53.09,39.33) v1(53.04,17.75) v1(53.04,5.72) v1(53.17,14.49) v2(3.22,22.41)
AD9833OUT: length 14.1
  Top Layer w0.381: C9.2 23.26,33.95 17,33.95
  Top Layer w0.508: C9.2 23.31,37.34 RAW_OUT.1 23.3,41.64 RAW_OUT(方波）.5
AMP_IN: length 3.9
  Top Layer w0.254: C9.1 25.51,32.51 R11.1 25.53,30.88 R10.2
EXT: length 3.4
  Top Layer w0.381: R7.1 6.87,26.4 EXT.5
FILTER_OUT: length 10
  Top Layer w0.254: U4.7 U4.6 38.04,21.71 C16.1 39.78,21.72 R18.1 R19.1 39.79,16.71 C17.1
FSYNC: length 2
  Top Layer w0.254: 17,32.95 18.93,32.95 R2.1
FSYNC_U: length 13.1
  Top Layer w0.254: R2.2 19.89,33 19.67,32.78 19.67,28.97 19.43,28.73 16.84,28.73 ; 16.41,29.17 16.41,28.73 ; 16.41,29.17 16.41,29.17 R5.1 ; 16.41,29.17 16.84,28.73 ; 16.41,28.73 16.41,28.3 ; 16.41,28.73 16.84,28.73 ; 16.84,28.73 16.41,28.3 ; 16.41,28.3 16.41,28.14 J1.2
OUT_AC: length 9.4
  Top Layer w0.254: R22.2 45.68,6.9 OUT_AC1.1 ; R22.2 R21.2 ; R22.2 47.16,9.85 R24.2 50.58,9.86 OUT_AC.5
SCLK: length 2.6
  Top Layer w0.254: R3.1 18.91,31.55 18.32,31.55 18.14,31.73 18.14,32.16 17.84,32.45 17,32.45
SCLK_U: length 13.7
  Top Layer w0.254: R3.2 21.62,31.47 22.15,30.94 22.15,25.25 21.97,25.07 18.26,25.07 17.95,25.39 J1.3
SDATA: length 3.8
  Top Layer w0.254: 17,31.95 17.58,31.95 17.78,31.76 17.78,30.13 17.97,29.94 R4.1
SDATA_U: length 2.8
  Top Layer w0.254: J1.4 20.49,27.14 R4.2
VMID_2V5: length 15.4
  Top Layer w0.254: U3.1 U3.2 38.39,33.46 32.35,33.46 32.17,33.28 30.89,33.28 R13.1 30.13,32.52 R11.3 28.03,31.03 27.86,30.86 R10.1
VMID_RAW: length 7.6
  Top Layer w0.254: U3.3 41.52,34.15 C10.1 R8.1 43.03,32.65 C11.1 43.26,32.44 R9.2
$1N474: length 1.9
  Top Layer w0.381: X2.3 7.41,31.24 R1.1
$1N1232: length 4.2
  Top Layer w0.254: C6.2 14,30.88 14.27,31.15 14.27,32.77 14.09,32.95 U1.3
$1N1272: length 3.6
  Top Layer w0.254: U1.1 12.73,34.01 12.73,35.18 12.56,35.35 10.49,35.35
$1N1684: length 9.4
  Top Layer w0.254: U1.5 12.7,31.87 12.7,31.48 12.66,31.44 12.66,30.31 12.7,30.27 12.7,29.57 12.51,29.38 R6.1
  Top Layer w0.381: R7.2 10.01,26.42 10.21,26.62 10.21,28.35 10.46,28.6 11.73,28.6 11.92,28.79 R6.1
$1N1686: length 1.5
  Top Layer w0.381: R1.2 10.42,29.38
$1N5113: length 6.8
  Top Layer w0.254: U3.5 33.55,35.42 R11.2
$1N5226: length 3.5
  Top Layer w0.254: R15.2 R14.1 33.18,32.51 U3.7
$1N5324: length 3.5
  Top Layer w0.254: U3.6 33.42,34.01 R14.2 31.64,34.04 30.14,34.04
$1N5858: length 7.2
  Top Layer w0.254: U4.1 U4.2 32.09,22.98 32.36,22.71 32.36,19.36 31.98,18.98 R16.2
$1N5895: length 7.3
  Top Layer w0.254: R16.1 34.62,18.98 R17.2 34.65,18.99 34.65,20.68 34.83,20.86 35.04,20.86 35.19,21 37.83,21 38.05,20.79 C16.2
$1N5900: length 3.1
  Top Layer w0.254: U4.5 36.14,20.41 R17.1 36.14,17.35 C15.2
$1N6266: length 10.6
  Top Layer w0.254: R19.2 R18.2 43.5,21.73 OUT.1 50.38,21.68 OUT_BIASED.5
$1N6533: length 5.9
  Top Layer w0.254: C17.2 44.14,11.36 R21.1 R22.1
$1N6657: length 1.5
  Top Layer w0.254: R15.1 R23.2
$1N6662: length 8.1
  Top Layer w0.254: U4.3 30.69,21.72 29.44,21.72 29.26,21.9 29.26,24.69 30.03,25.46 C14.2 31.66,26.53 R23.1

## Copper pours and planes (outline as drawn; the poured copper is in the pictures)
AGND on Top Layer: -1.02,45.73 54.86,45.73 54.86,-0.7 -1.02,-0.7
AGND on Bottom Layer: -2.64,47 58.32,47 58.32,-4.46 -2.64,-4.46

## Text on the board
Top Silkscreen Layer: gnd | FSYNC | SCLK | SDATA | 焊R6,0Ω：内部时钟 /焊R7，0Ω：外部时钟 | RAW 原始 / BIAS 偏置 / AC 交流 | R18,R21,0Ω：高阻输出 / R19,R22,49.9Ω：50Ω输出选焊
